# Altium project PCB_Project.PrjPcb (part 2 of 4)

## Sheet Power Supply.SchDoc
size A4; SheetNumber: 2; SheetTotal: 4
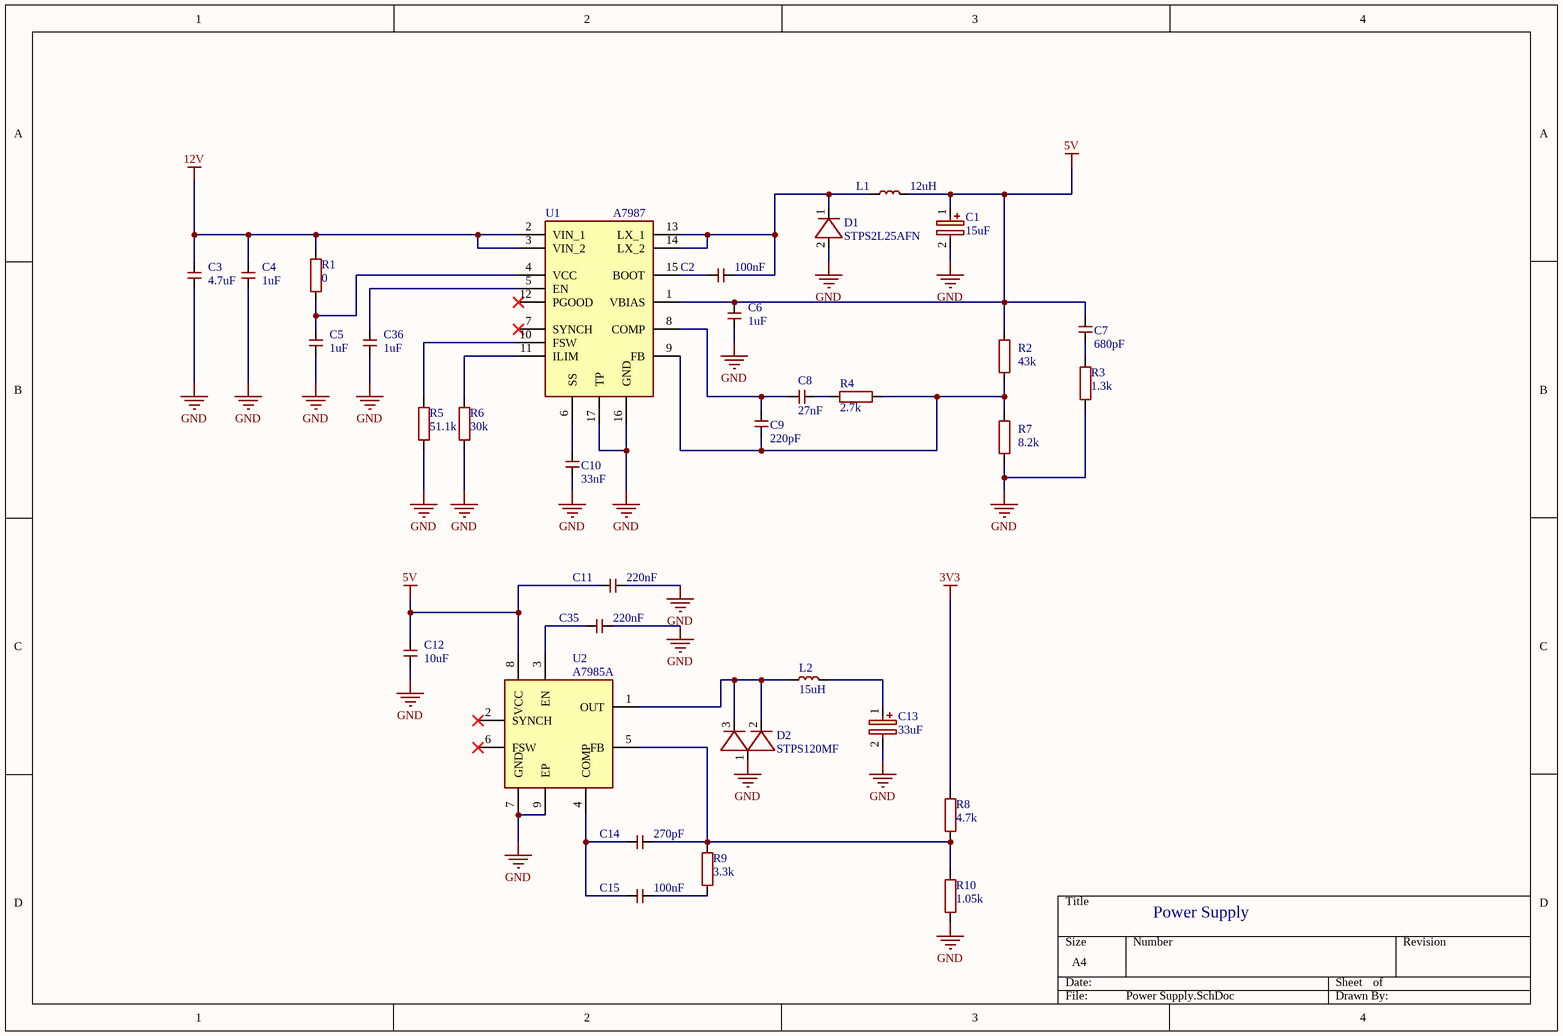
[diagram p1: Power Supply.SchDoc]

### Parts
C1  15uF  [CAPAE660X850N]
C2  100nF  [C0402]
C3  4.7uF  [CAPC3216X180N]
C4  1uF  [C0402]
C5  1uF  [C0402]
C6  1uF  [C0402]
C7  680pF  [C0402]
C8  27nF  [C0402]
C9  220pF  [C0402]
C10  33nF  [C0402]
C11  220nF  [C0402]
C12  10uF  [CAPC2012X145N]
C13  33uF  [10SVPS10M]
C14  270pF  [C0402]
C15  100nF  [C0402]
C35  220nF  [C0402]
C36  1uF  [C0402]
D1  STPS2L25AFN  [SODFL5226X110N]
D2  STPS120MF  [STPS120MF]
L1  12uH  [WE-PD2_105455]
L2  15uH  [INDPM6868X420N]
R1  0  [R0402]
R2  43k  [R0402]
R3  1.3k  [R0402]
R4  2.7k  [R0402]
R5  51.1k  [R0402]
R6  30k  [R0402]
R7  8.2k  [R0402]
R8  4.7k  [R0402]
R9  3.3k  [R0402]
R10  1.05k  [R0402]
U1  A7987  [SOP65P640X120-17N]
U2  A7985A  [SOIC127P600X170-9N]

### Nets
3V3: R8.2
5V: C1.1(+) C6.1 C7.2 C11.1 C12.2 L1.2 R2.2 U1.1(VBIAS) U2.8(VCC)
12V: C3.2 C4.2 R1.2 U1.2(VIN_1) U1.3(VIN_2)
GND: C1.2 C3.1 C4.1 C5.1 C6.2 C10.1 C11.2 C12.1 C13.2 C35.2 C36.1 D1.2(A) D2.1(A) R3.1 R5.1 R6.1 R7.1 R10.1 U1.16(GND) U1.17(TP) U2.7(GND) U2.9(EP)
NetC2_1: C2.1 U1.15(BOOT)
NetC2_2: C2.2 D1.1(K) L1.1 U1.13(LX_1) U1.14(LX_2)
NetC5_2: C5.2 R1.1 U1.4(VCC)
NetC7_1: C7.1 R3.2
NetC8_1: C8.1 C9.2 U1.8(COMP)
NetC8_2: C8.2 R4.1
NetC9_1: C9.1 R2.1 R4.2 R7.2 U1.9(FB)
NetC10_2: C10.2 U1.6(SS)
NetC13_1: C13.1(+) L2.2
NetC14_1: C14.1 C15.1 U2.4(COMP)
NetC14_2: C14.2 R8.1 R9.2 R10.2 U2.5(FB)
NetC15_2: C15.2 R9.1
NetC35_1: C35.1 U2.3(EN)
NetC36_2: C36.2 U1.5(EN)
NetD2_2: D2.2(K) D2.3(K) L2.1 U2.1(OUT)
NetR5_2: R5.2 U1.10(FSW)
NetR6_2: R6.2 U1.11(ILIM)

Not connected (* = marked no-connect by the designer): U1 7(SYNCH)* 12(PGOOD)*; U2 2(SYNCH)* 6(FSW)*

### Notes on the sheet
- Power Supply

### Library data of the parts
C1 = AHA0608150M050R: Hybrid Aluminum V-Chip, 15uF, 50V | AVX AHA0608150M050R; Manufacturer: Kyocera AVX; Supplier: Mouser; Supplier Part Number: 581-AHA0608150M050R; Manufacturer Part Number: AHA0608150M050R; RoHS: No; Category: Polymer Capacitors; Stock: 134; Pricing: 1=0.93, 10=0.586, 50=0.586, 100=0.582, 1000=0.494, 10000=0.262 (USD)
C2 C15 = C0402C104K3PACTU: Ceramic Capacitor, Multilayer, Ceramic, 25V, 10% +Tol, 10% -Tol, X5R, 15% TC, 0.1uF, Surface Mount, 0402; Manufacturer: KEMET; Multilayer: Yes; Supplier: Mouser; Supplier Part Number: 80-C0402C104K3P; Manufacturer Part Number: C0402C104K3PACTU; RoHS: Yes; Category: Ceramic Capacitors; Stock: 262570; Pricing: 1=0.12, 10=0.056, 50=0.056, 100=0.036, 1000=0.026, 10000=0.017 (USD); Mounting Technology: Surface Mount; Pins: 2; Dielectric Material: Ceramic; Package Shape: Rectangular; Case/Package: 0402; Terminal Finish: Nickel; Min Operating Temperature: -55°C; Max Operating Temperature: 85°C; JESD-609 Code: e3; Value: 100nF; Capacitor Type: Ceramic; Tolerance  (fill in as +-): 10%; Packaging: Tape and Reel; Tolerance (fill in as +-): 10%; Rated DC Voltage (URdc): 25V; Temperature Characteristics Code: X5R; Termination: Wraparound; Reach SVHC Compliant: Yes; RoHS Compliant: Yes; ComponentLink1URL: https://datasheet.ciiva.com:443/pdfs/VipMasterIC/IC/KEME/KEME-S-A0008991665/KEME-S-A0008991665-1.pdf?src-supplier=IHS+Markit; ComponentLink1Description: https://datasheet.ciiva.com:443/pdfs/VipMasterIC/IC/KEME/KEME-S-A0008991665/KEME-S-A0008991665-1.pdf?src-supplier=IHS+Markit; ComponentLink2URL: http://www.farnell.com/datasheets/2748284.pdf?src-supplier=Farnell; ComponentLink2Description: http://www.farnell.com/datasheets/2748284.pdf?src-supplier=Farnell; ComponentLink3URL: http://www.farnell.com/datasheets/2748284.pdf?src-supplier=Newark; ComponentLink3Description: http://www.farnell.com/datasheets/2748284.pdf?src-supplier=Newark; ComponentLink4URL: https://datasheet.octopart.com/C0402C104K3PACTU-KEMET-datasheet-181956028.pdf?src-supplier=Element14; ComponentLink4Description: https://datasheet.octopart.com/C0402C104K3PACTU-KEMET-datasheet-181956028.pdf?src-supplier=Element14
C3 = EMK316BJ475MLHT: Ceramic Capacitor, Multilayer, Ceramic, 16V, 20% +Tol, 20% -Tol, X5R, 15% TC, 4.7uF, Surface Mount, 1206; Manufacturer: Taiyo Yuden; Supplier: Mouser; Supplier Part Number: 963-EMK316BJ475MLHT; Manufacturer Part Number: EMK316BJ475MLHT; RoHS: No; Category: Ceramic Capacitors; Pricing: 1=0.3, 10=0.182, 50=0.182, 100=0.118, 1000=0.085, 10000=0.063 (USD); ComponentLink1URL: https://ds.yuden.co.jp/TYCOMPAS/ut/detail?pn=EMK316BJ475MLHT &amp;u=M&src-supplier=Digikey; ComponentLink1Description: https://ds.yuden.co.jp/TYCOMPAS/ut/detail?pn=EMK316BJ475MLHT &amp;u=M&src-supplier=Digikey
C4-C6 C36 = C0402C105K4PAC7411: Ceramic Capacitor, Multilayer, Ceramic, 16V, 10% +Tol, 10% -Tol, X5R, 15% TC, 1uF, Surface Mount, 0402; Manufacturer: KEMET; Multilayer: Yes; Supplier: Mouser; Supplier Part Number: 80-C0402C105K4P7411; Manufacturer Part Number: C0402C105K4PAC7411; RoHS: Yes; Category: Ceramic Capacitors; Stock: 78488; Pricing: 1=0.11, 10=0.061, 50=0.061, 100=0.037, 1000=0.024, 10000=0.019 (USD); Mounting Technology: Surface Mount; Pins: 2; Dielectric Material: Ceramic; Package Shape: Rectangular; Case/Package: 0402; Min Operating Temperature: -55°C; Max Operating Temperature: 85°C; Value: 1uF; Capacitor Type: Ceramic; Tolerance  (fill in as +-): 10%; Packaging: Tape and Reel; Tolerance (fill in as +-): 10%; Rated DC Voltage (URdc): 16V; Temperature Characteristics Code: X5R; Termination: Wraparound; Reach SVHC Compliant: Yes; RoHS Compliant: Yes; ComponentLink1URL: https://datasheet.ciiva.com:443/pdfs/VipMasterIC/IC/KEME/KEME-S-A0008991665/KEME-S-A0008991665-1.pdf?src-supplier=IHS+Markit; ComponentLink1Description: https://datasheet.ciiva.com:443/pdfs/VipMasterIC/IC/KEME/KEME-S-A0008991665/KEME-S-A0008991665-1.pdf?src-supplier=IHS+Markit; ComponentLink2URL: https://api.kemet.com/component-edge/download/datasheet/C0402C105K4PAC7411.pdf?src-supplier=Digikey; ComponentLink2Description: https://api.kemet.com/component-edge/download/datasheet/C0402C105K4PAC7411.pdf?src-supplier=Digikey; ComponentLink3URL: https://datasheet.octopart.com/C0402C105K4PAC7411-KEMET-datasheet-142027389.pdf?src-supplier=Farnell; ComponentLink3Description: https://datasheet.octopart.com/C0402C105K4PAC7411-KEMET-datasheet-142027389.pdf?src-supplier=Farnell
C7 = C0402C681K8RACTU: Ceramic Capacitor, Multilayer, Ceramic, 10V, 10% +Tol, 10% -Tol, X7R, 15% TC, 0.00068uF, Surface Mount, 0402; Manufacturer: KEMET; Multilayer: Yes; Supplier: Mouser; Supplier Part Number: 80-C0402C681K8RACTU; Manufacturer Part Number: C0402C681K8RACTU; RoHS: Yes; Category: Capacitors; Stock: 44783; Pricing: 1=0.34, 10=0.202, 50=0.202, 100=0.132, 1000=0.095, 10000=0.077 (USD); Mounting Technology: Surface Mount; Pins: 2; Dielectric Material: Ceramic; Case/Package: 0402; Terminal Finish: Nickel; Package Shape: Rectangular; Min Operating Temperature: -55°C; Max Operating Temperature: 125°C; JESD-609 Code: e3; Value: 680pF; Capacitor Type: Ceramic; Tolerance  (fill in as +-): 10%; Package Style: SMTMeter; Packaging: Tape and Reel; Tolerance (fill in as +-): 10%; Rated DC Voltage (URdc): 10V; Temperature Characteristics Code: X7R; Termination: Wraparound; Length: 1mm; Width: 0.5mm; Height: 0.5mm; Reach SVHC Compliant: Yes; RoHS Compliant: Yes; ComponentLink1URL: https://datasheet.ciiva.com:443/pdfs/VipMasterIC/IC/KEME/KEME-S-A0008991654/KEME-S-A0008991654-1.pdf?src-supplier=IHS+Markit; ComponentLink1Description: https://datasheet.ciiva.com:443/pdfs/VipMasterIC/IC/KEME/KEME-S-A0008991654/KEME-S-A0008991654-1.pdf?src-supplier=IHS+Markit
C8 = C0402C273K4RALTU: .027Uf 16.0V Rohs Compliant: No; Manufacturer: KEMET; Supplier: Mouser; Supplier Part Number: 80-C0402C273K4RALTU; Manufacturer Part Number: C0402C273K4RALTU; RoHS: No; Stock: 9745; Pricing: 1=0.57, 10=0.374, 50=0.374, 100=0.225, 1000=0.167, 10000=0.115 (USD)
C9 = C0402S221K5RACAUTO: Ceramic Capacitor, Multilayer, Ceramic, 50V, 10% +Tol, 10% -Tol, X7R, 15% TC, 0.00022uF, Surface Mount, 0402; Manufacturer: KEMET; Supplier: Mouser; Supplier Part Number: 80-C0402S221K5RAUTO; Manufacturer Part Number: C0402S221K5RACAUTO; RoHS: Yes; Category: Ceramic Capacitors; Stock: 19717; Pricing: 1=0.43, 10=0.225, 50=0.225, 100=0.163, 1000=0.127, 10000=0.098 (USD); Pins: 2; Dielectric Material: Ceramic; Capacitor Type: Ceramic; Reach SVHC Compliant: Yes; RoHS Compliant: Yes; ComponentLink1URL: https://datasheet.ciiva.com:443/pdfs/VipMasterIC/IC/KEME/KEME-S-A0008958426/KEME-S-A0008958426-1.pdf?src-supplier=IHS+Markit; ComponentLink1Description: https://datasheet.ciiva.com:443/pdfs/VipMasterIC/IC/KEME/KEME-S-A0008958426/KEME-S-A0008958426-1.pdf?src-supplier=IHS+Markit
C10 = C0402C333M4REC7411: Ceramic Capacitor, Multilayer, Ceramic, 16V, 20% +Tol, 20% -Tol, X7R, 15% TC, 0.033uF, Surface Mount, 0402; Manufacturer: KEMET; Supplier: Mouser; Supplier Part Number: 80-C0402C333M4RECLR; Manufacturer Part Number: C0402C333M4REC7411; RoHS: Yes; Category: Ceramic Capacitors; Stock: 47561; Pricing: 1=0.1, 10=0.059, 50=0.059, 100=0.036, 1000=0.026, 10000=0.018 (USD); Pins: 2; Dielectric Material: Ceramic; Capacitor Type: Ceramic; Reach SVHC Compliant: Yes; RoHS Compliant: Yes; ComponentLink1URL: https://datasheet.ciiva.com:443/pdfs/VipMasterIC/IC/KEME/KEME-S-A0008958450/KEME-S-A0008958450-1.pdf?src-supplier=IHS+Markit; ComponentLink1Description: https://datasheet.ciiva.com:443/pdfs/VipMasterIC/IC/KEME/KEME-S-A0008958450/KEME-S-A0008958450-1.pdf?src-supplier=IHS+Markit; ComponentLink2URL: https://api.kemet.com/component-edge/download/datasheet/C0402C333M4REC7411.pdf?src-supplier=Digikey; ComponentLink2Description: https://api.kemet.com/component-edge/download/datasheet/C0402C333M4REC7411.pdf?src-supplier=Digikey
C11 C35 = C0402C224K9PAC7411: Ceramic Capacitor, Multilayer, Ceramic, 6.3V, 10% +Tol, 10% -Tol, X5R, 15% TC, 0.22uF, Surface Mount, 0402; Manufacturer: KEMET; Multilayer: Yes; Supplier: Mouser; Supplier Part Number: 80-C0402C224K9PACLR; Manufacturer Part Number: C0402C224K9PAC7411; RoHS: Yes; Category: Ceramic Capacitors; Stock: 143956; Pricing: 1=0.1, 10=0.018, 50=0.018, 100=0.015, 1000=0.015, 10000=0.015 (USD); Mounting Technology: Surface Mount; Pins: 2; Dielectric Material: Ceramic; Package Shape: Rectangular; Case/Package: 0402; Terminal Finish: Nickel; Min Operating Temperature: -55°C; Max Operating Temperature: 85°C; JESD-609 Code: e3; Value: 220nF; Capacitor Type: Ceramic; Tolerance  (fill in as +-): 10%; Package Style: SMTMeter; Packaging: Tape and Reel; Tolerance (fill in as +-): 10%; Rated DC Voltage (URdc): 6.3V; Temperature Characteristics Code: X5R; Termination: Wraparound; Length: 1mm; Width: 0.5mm; Height: 0.5mm; Reach SVHC Compliant: Yes; RoHS Compliant: Yes; ComponentLink1URL: https://datasheet.ciiva.com:443/pdfs/VipMasterIC/IC/KEME/KEME-S-A0008991665/KEME-S-A0008991665-1.pdf?src-supplier=IHS+Markit; ComponentLink1Description: https://datasheet.ciiva.com:443/pdfs/VipMasterIC/IC/KEME/KEME-S-A0008991665/KEME-S-A0008991665-1.pdf?src-supplier=IHS+Markit; ComponentLink2URL: http://capacitoredge.kemet.com/capedge2/DataSheet?pn=C0402C224K9PAC7411&src-supplier=Avnet; ComponentLink2Description: http://capacitoredge.kemet.com/capedge2/DataSheet?pn=C0402C224K9PAC7411&src-supplier=Avnet; ComponentLink3URL: https://datasheet.octopart.com/C0402C224K9PAC7411-KEMET-datasheet-182899637.pdf?src-supplier=Farnell; ComponentLink3Description: https://datasheet.octopart.com/C0402C224K9PAC7411-KEMET-datasheet-182899637.pdf?src-supplier=Farnell
C12 = GRM21BR60J106KE19L: Ceramic Capacitor, Multilayer, Ceramic, 6.3V, 10% +Tol, 10% -Tol, X5R, 15% TC, 10uF, Surface Mount, 0805; Manufacturer: Murata; Multilayer: Yes; Supplier: Arrow Electronics; Supplier Part Number: GRM21BR60J106KE19L; Manufacturer Part Number: GRM21BR60J106KE19L; RoHS: Yes; Category: Ceramic Capacitors; Stock: 462000; Pricing: 3000=0.0427, 9000=0.0414, 24000=0.037, 45000=0.0357 (USD); Mounting Technology: Surface Mount; Pins: 2; Dielectric Material: Ceramic; Package Shape: Rectangular; Case/Package: 0805; Terminal Finish: Nickel; Min Operating Temperature: -55°C; Max Operating Temperature: 85°C; JESD-609 Code: e3; Value: 10uF; Capacitor Type: Ceramic; Tolerance  (fill in as +-): 10%; Package Style: SMTMeter; Packaging: Tape and Reel; Tolerance (fill in as +-): 10%; Rated DC Voltage (URdc): 6.3V; Temperature Characteristics Code: X5R; Termination: Wraparound; Length: 2mm; Width: 1.25mm; Height: 1.25mm; Reach SVHC Compliant: Yes; RoHS Compliant: Yes; ComponentLink1URL: https://datasheet.ciiva.com:443/pdfs/VipMasterIC/IC/MURE/MURE-S-A0004349797/MURE-S-A0004361791-1.pdf?src-supplier=IHS+Markit; ComponentLink1Description: https://datasheet.ciiva.com:443/pdfs/VipMasterIC/IC/MURE/MURE-S-A0004349797/MURE-S-A0004361791-1.pdf?src-supplier=IHS+Markit; ComponentLink2URL: https://datasheet.ciiva.com/3777/131grm21br60j106ke1923-3777038.pdf?src-supplier=Arrow+Electronics; ComponentLink2Description: https://datasheet.ciiva.com/3777/131grm21br60j106ke1923-3777038.pdf?src-supplier=Arrow+Electronics; ComponentLink3URL: https://datasheet.ciiva.com/136/product-136502.pdf?src-supplier=Digikey; ComponentLink3Description: https://datasheet.ciiva.com/136/product-136502.pdf?src-supplier=Digikey; ComponentLink4URL: https://datasheet.ciiva.com/19476/1858851-19476205.pdf?src-supplier=Jameco; ComponentLink4Description: https://datasheet.ciiva.com/19476/1858851-19476205.pdf?src-supplier=Jameco; ComponentLink5URL: https://datasheet.ciiva.com/7719/608985-7719084.pdf?src-supplier=Element14; ComponentLink5Description: https://datasheet.ciiva.com/7719/608985-7719084.pdf?src-supplier=Element14; ComponentLink6URL: https://datasheet.ciiva.com/136/product-136500.pdf?src-supplier=Digikey; ComponentLink6Description: https://datasheet.ciiva.com/136/product-136500.pdf?src-supplier=Digikey; ComponentLink7URL: https://datasheet.ciiva.com/136/product-136501.pdf?src-supplier=Digikey; ComponentLink7Description: https://datasheet.ciiva.com/136/product-136501.pdf?src-supplier=Digikey
C13 = 4SVP33M: Aluminum Electrolytic Capacitor, Polarized, Aluminum (solid Polymer), 4V, 20% +Tol, 20% -Tol, 33uF, Surface Mount, 1717; Manufacturer: Panasonic; Manufacturer Series: SVP; Dielectric Material: Aluminium; ESR (Equivalent Series Resistance): 200mR; Leakage Current: 66uA; Ripple Current: 37mA; Tan Delta: 0.15; Supplier: Mouser; Supplier Part Number: 667-4SVP33M; Manufacturer Part Number: 4SVP33M; RoHS: Yes; Category: Aluminum Electrolytic Capacitors; Stock: 1637; Pricing: 1=0.67, 10=0.519, 50=0.519, 100=0.508, 1000=0.44, 10000=0.362 (USD); Mounting Technology: Surface Mount; Pins: 2; Package Shape: Cylindrical; Case/Package: 1717; Min Operating Temperature: -55°C; Max Operating Temperature: 105°C; Polarity: Polarized; Value: 33uF; Capacitor Type: Aluminium; Tolerance  (fill in as +-): 20%; Package Style: SMTMeter; Packaging: Tape and Reel; Tolerance (fill in as +-): 20%; Rated DC Voltage (URdc): 4V; Series: SVP; Termination: Flat; Length: 5mm; Width: 4.3mm; Height: 5.4mm; Reach SVHC Compliant: Yes; RoHS Compliant: Yes; ComponentLink1URL: https://datasheet.ciiva.com:443/pdfs/VipMasterIC/IC/PANA/PANA-S-A0009016943/PANA-S-A0009016943-1.pdf?src-supplier=IHS+Markit; ComponentLink1Description: https://datasheet.ciiva.com:443/pdfs/VipMasterIC/IC/PANA/PANA-S-A0009016943/PANA-S-A0009016943-1.pdf?src-supplier=IHS+Markit; ComponentLink2URL: https://datasheet.ciiva.com/24477/svp-series-datasheet-24477337.pdf?src-supplier=Onlinecomponents.com; ComponentLink2Description: https://datasheet.ciiva.com/24477/svp-series-datasheet-24477337.pdf?src-supplier=Onlinecomponents.com
C14 = C0402C271J5GAC7411: Ceramic Capacitor, Multilayer, Ceramic, 50V, 5% +Tol, 5% -Tol, C0G, 30ppm/Cel TC, 0.00027uF, Surface Mount, 0402; Manufacturer: KEMET; Multilayer: Yes; Supplier: Mouser; Supplier Part Number: 80-C0402C271J5G7411; Manufacturer Part Number: C0402C271J5GAC7411; RoHS: Yes; Category: Ceramic Capacitors; Stock: 143215; Pricing: 1=0.1, 10=0.018, 50=0.018, 100=0.011, 1000=0.008, 10000=0.007 (USD); Mounting Technology: Surface Mount; Pins: 2; Dielectric Material: Ceramic; Package Shape: Rectangular; Case/Package: 0402; Terminal Finish: Nickel; Min Operating Temperature: -55°C; Max Operating Temperature: 125°C; JESD-609 Code: e3; Value: 270pF; Capacitor Type: Ceramic; Tolerance  (fill in as +-): 5%; Package Style: SMTMeter; Packaging: Tape and Reel; Tolerance (fill in as +-): 5%; Rated DC Voltage (URdc): 50V; Temperature Characteristics Code: C0G; Termination: Wraparound; Length: 1mm; Width: 0.5mm; Height: 0.5mm; Reach SVHC Compliant: Yes; RoHS Compliant: Yes; ComponentLink1URL: https://datasheet.ciiva.com:443/pdfs/VipMasterIC/IC/KEME/KEME-S-A0005605168/KEME-S-A0005605168-1.pdf?src-supplier=IHS+Markit; ComponentLink1Description: https://datasheet.ciiva.com:443/pdfs/VipMasterIC/IC/KEME/KEME-S-A0005605168/KEME-S-A0005605168-1.pdf?src-supplier=IHS+Markit
D1 = STPS2L25AFN: Rectifier Diode; Manufacturer: STMicroelectronics; Supplier: Farnell; Supplier Part Number: 3387295; Manufacturer Part Number: STPS2L25AFN; RoHS: Yes; Category: Rectifier Diodes; Stock: 3; Pricing: 1=1 (EUR)
D2 = STPS120MF: Rectifier Diode, Schottky, 1 Phase, 1 Element, 1A, 20V V(RRM), Silicon, DO-222AA; Manufacturer: STMicroelectronics; Package Body Material: Plastic; Case Connection: CATHODE; Forward Voltage: 410mV; Non-rep Pk Forward Current-Max: 50A; Number of Elements: 1; Qualification Status: Not Qualified; Supplier: Mouser; Supplier Part Number: 511-STPS120MF; Manufacturer Part Number: STPS120MF; RoHS: Yes; Category: Rectifier Diodes; Stock: 19149; Pricing: 1=0.28, 10=0.18, 50=0.18, 100=0.118, 1000=0.092, 10000=0.084 (USD); Pins: 2; Diode Element Material: SILICON; Package Shape: Rectangular; Max Operating Temperature: 150°C; Diode Type: RECTIFIER; JESD-30 Code: R-PDSO-F2; Max Output current: 1A; Package Style: SMALL OUTLINEMeter; Rep Pk Reverse Voltage-Max: 20V; Surface Mount: Yes; Technology: SCHOTTKY; Terminal Form: Flat; Terminal Position: DUAL; Reach SVHC Compliant: Yes; RoHS Compliant: Yes; ComponentLink1URL: https://datasheet.ciiva.com:443/pdfs/VipMasterIC/IC/SGST/SGST-S-A0001365098/SGST-S-A0001365098-1.pdf?src-supplier=IHS+Markit; ComponentLink1Description: https://datasheet.ciiva.com:443/pdfs/VipMasterIC/IC/SGST/SGST-S-A0001365098/SGST-S-A0001365098-1.pdf?src-supplier=IHS+Markit; ComponentLink2URL: https://datasheet.ciiva.com/4714/cd00198749-86002-4714686.pdf?src-supplier=Mouser; ComponentLink2Description: https://datasheet.ciiva.com/4714/cd00198749-86002-4714686.pdf?src-supplier=Mouser; ComponentLink3URL: https://datasheet.ciiva.com/16491/cd00198749-16491507.pdf?src-supplier=Future+Electronics; ComponentLink3Description: https://datasheet.ciiva.com/16491/cd00198749-16491507.pdf?src-supplier=Future+Electronics; ComponentLink4URL: https://datasheet.ciiva.com/916/cd00198749-916327.pdf?src-supplier=Digikey; ComponentLink4Description: https://datasheet.ciiva.com/916/cd00198749-916327.pdf?src-supplier=Digikey; ComponentLink5URL: https://datasheet.ciiva.com/916/cd00198749-916328.pdf?src-supplier=Digikey; ComponentLink5Description: https://datasheet.ciiva.com/916/cd00198749-916328.pdf?src-supplier=Digikey; ComponentLink6URL: https://datasheet.ciiva.com/916/cd00198749-916329.pdf?src-supplier=Digikey; ComponentLink6Description: https://datasheet.ciiva.com/916/cd00198749-916329.pdf?src-supplier=Digikey
L1 = 744776112: General Purpose Inductor, 12uH, 20%, 1 Element, Nickel-zinc Ferrite-Core, SMD, 3935; Manufacturer: Wurth Electronics; DC Resistance (DCR): 70mR; Inductor Application: POWER INDUCTOR; Channels: 1; Max Current Rating: 2.72A; Shape/Size Description: RECTANGULAR PACKAGE; Shielding: Unshielded; Test Frequency: 1kHz; Self Resonant Frequency: 20MHz; Supplier: Mouser; Supplier Part Number: 710-744776112; Manufacturer Part Number: 744776112; RoHS: Yes; Category: Fixed Inductors; Stock: 180; Pricing: 1=2.29, 10=2.22, 50=2.14, 100=2.1, 1000=1.7, 10000=1.7 (USD); Pins: 2; Terminal Finish: Copper; Core Material: Ferrite; Min Operating Temperature: -40°C; Max Operating Temperature: 125°C; Tolerance: 20%; JESD-609 Code: e1; Inductance-Nom (L): 12uH; Inductor Type: GENERAL PURPOSE INDUCTOR; Surface Mount: Yes; Terminal Placement: Dual Ended; Termination: One Surface; Reach SVHC Compliant: Yes; RoHS Compliant: Yes; ComponentLink1URL: https://datasheet.ciiva.com:443/pdfs/VipMasterIC/IC/MIDC/MIDC-S-A0009028210/MIDC-S-A0009028303-1.pdf?src-supplier=IHS+Markit; ComponentLink1Description: https://datasheet.ciiva.com:443/pdfs/VipMasterIC/IC/MIDC/MIDC-S-A0009028210/MIDC-S-A0009028303-1.pdf?src-supplier=IHS+Markit; ComponentLink2URL: https://datasheet.ciiva.com/1063/744776112-1063302.pdf?src-supplier=Digikey; ComponentLink2Description: https://datasheet.ciiva.com/1063/744776112-1063302.pdf?src-supplier=Digikey; ComponentLink3URL: https://datasheet.ciiva.com/6696/744776112-6696301.pdf?src-supplier=Digikey; ComponentLink3Description: https://datasheet.ciiva.com/6696/744776112-6696301.pdf?src-supplier=Digikey; ComponentLink4URL: https://datasheet.ciiva.com/4954/744776112-37936-4954902.pdf?src-supplier=Mouser; ComponentLink4Description: https://datasheet.ciiva.com/4954/744776112-37936-4954902.pdf?src-supplier=Mouser; ComponentLink5URL: https://datasheet.ciiva.com/7892/1736454-7892919.pdf?src-supplier=Element14; ComponentLink5Description: https://datasheet.ciiva.com/7892/1736454-7892919.pdf?src-supplier=Element14; ComponentLink6URL: https://datasheet.ciiva.com/6696/744776112-6696300.pdf?src-supplier=Digikey; ComponentLink6Description: https://datasheet.ciiva.com/6696/744776112-6696300.pdf?src-supplier=Digikey
L2 = SRR6838A-150M: Power Inductors - SMD Ind,6.8x6.8x3.8mm,15uH+/-20%,2.1A,; Manufacturer: Bourns; Supplier: Mouser; Supplier Part Number: 652-SRR6838A-150M; Manufacturer Part Number: SRR6838A-150M; RoHS: No; Stock: 987; Pricing: 1=1.28, 10=0.992, 50=0.992, 100=0.851, 1000=0.723, 10000=0.695 (USD)
R1 = AC0402JR-7D0RL: Fixed Resistor, Metal Glaze/thick Film, 0.0625W, 0ohm, Surface Mount, 0402; Manufacturer: Yageo; Supplier: Mouser; Supplier Part Number: 603-AC0402JR-7D0RL; Manufacturer Part Number: AC0402JR-7D0RL; RoHS: Yes; Category: Resistors; Stock: 155617; Pricing: 1=0.14, 10=0.014, 50=0.014, 100=0.009, 1000=0.008, 10000=0.004 (USD)
R2 = AF0402FR-0743KL: Fixed Resistor, Metal Glaze/thick Film, 0.0625W, 43000ohm, 50V, 1% +/-Tol, 100ppm/Cel, Surface Mount, 0402; Manufacturer: Yageo; Additional Feature: ANTI-SULFUR; Power: 62.5mW; Rated Temperature: 70°C; Value: 43kR; Temperature Coefficient (ppm/Cel): 100; Package Height: 0.32mm; Package Length: 1mm; Package Width: 0.5mm; Reference Standard: AEC-Q200; Supplier: Mouser; Supplier Part Number: 603-AF0402FR-0743KL; Manufacturer Part Number: AF0402FR-0743KL; RoHS: Yes; Category: Chip SMD Resistors; Stock: 9222; Pricing: 1=0.1, 10=0.022, 50=0.022, 100=0.016, 1000=0.012, 10000=0.006 (USD); Mounting Technology: Surface Mount; Pins: 2; Case/Package: 0402; Min Operating Temperature: -55°C; Max Operating Temperature: 155°C; Tolerance: 1%; Resistor Type: FIXED RESISTOR; Construction: Rectangular; Packaging: Tape and Reel; Termination: Wraparound; Working Voltage: 50V; Reach SVHC Compliant: Yes; RoHS Compliant: Yes; ComponentLink1URL: https://datasheet.ciiva.com:443/pdfs/VipMasterIC/IC/YAGO/YAGO-S-A0009016998/YAGO-S-A0009016998-1.pdf?src-supplier=IHS+Markit; ComponentLink1Description: https://datasheet.ciiva.com:443/pdfs/VipMasterIC/IC/YAGO/YAGO-S-A0009016998/YAGO-S-A0009016998-1.pdf?src-supplier=IHS+Markit; ComponentLink2URL: http://www.yageo.com/documents/recent/PYu-AF_51_RoHS_L_5.pdf?src-supplier=Digikey; ComponentLink2Description: http://www.yageo.com/documents/recent/PYu-AF_51_RoHS_L_5.pdf?src-supplier=Digikey
R3 = AT0402DRD071K3L: Fixed Resistor, Thin Film, 0.0625W, 1300ohm, 50V, 0.5% +/-Tol, 25ppm/Cel, Surface Mount, 0402; Manufacturer: Yageo; Additional Feature: HIGH PRECISION; Power: 62.5mW; Rated Temperature: 70°C; Value: 1.3kR; Temperature Coefficient (ppm/Cel): 25; Package Height: 0.3mm; Package Length: 1mm; Package Width: 0.5mm; Reference Standard: AEC-Q200; Supplier: Mouser; Supplier Part Number: 603-AT0402DRD071K3L; Manufacturer Part Number: AT0402DRD071K3L; RoHS: Yes; Category: Chip SMD Resistors; Stock: 5742; Pricing: 1=0.14, 10=0.102, 50=0.082, 100=0.073, 1000=0.05, 10000=0.031 (USD); Mounting Technology: Surface Mount; Pins: 2; Package Shape: Rectangular; Case/Package: 0402; Min Operating Temperature: -55°C; Max Operating Temperature: 155°C; Tolerance: 0.5%; Resistor Type: FIXED RESISTOR; Construction: Chip; Packaging: Tape and Reel; Technology: THIN FILM; Termination: Wraparound; Working Voltage: 50V; Reach SVHC Compliant: Yes; RoHS Compliant: Yes; ComponentLink1URL: https://datasheet.ciiva.com:443/pdfs/VipMasterIC/IC/YAGO/YAGO-S-A0003527576/YAGO-S-A0003527576-1.pdf?src-supplier=IHS+Markit; ComponentLink1Description: https://datasheet.ciiva.com:443/pdfs/VipMasterIC/IC/YAGO/YAGO-S-A0003527576/YAGO-S-A0003527576-1.pdf?src-supplier=IHS+Markit; ComponentLink2URL: http://www.yageo.com/documents/recent/PYu-AT_51_RoHS_L-3.pdf?src-supplier=Digikey; ComponentLink2Description: http://www.yageo.com/documents/recent/PYu-AT_51_RoHS_L-3.pdf?src-supplier=Digikey
R4 = AC0402FR-072K7L: Fixed Resistor, Metal Glaze/thick Film, 0.0625W, 2700ohm, 50V, 1% +/-Tol, 100ppm/Cel, Surface Mount, 0402; Manufacturer: Yageo; Additional Feature: LASER TRIMMABLE; Power: 62.5mW; Rated Temperature: 70°C; Value: 2.7kR; Temperature Coefficient (ppm/Cel): 100; Package Height: 0.32mm; Package Length: 1mm; Package Width: 0.5mm; Reference Standard: AEC-Q200; Supplier: Mouser; Supplier Part Number: 603-AC0402FR-072K7L; Manufacturer Part Number: AC0402FR-072K7L; RoHS: Yes; Category: Chip SMD Resistors; Stock: 89734; Pricing: 1=0.1, 10=0.009, 50=0.009, 100=0.007, 1000=0.005, 10000=0.002 (USD); Mounting Technology: Surface Mount; Pins: 2; Package Shape: Rectangular; Case/Package: 0402; Terminal Finish: Nickel; Min Operating Temperature: -55°C; Max Operating Temperature: 155°C; Tolerance: 1%; JESD-609 Code: e3; Resistor Type: FIXED RESISTOR; Construction: Chip; Packaging: Tape and Reel; Technology: METAL GLAZE/THICK FILM; Termination: Wraparound; Working Voltage: 50V; Reach SVHC Compliant: Yes; RoHS Compliant: Yes; ComponentLink1URL: https://datasheet.ciiva.com:443/pdfs/VipMasterIC/IC/YAGO/YAGO-S-A0003597364/YAGO-S-A0003597364-1.pdf?src-supplier=IHS+Markit; ComponentLink1Description: https://datasheet.ciiva.com:443/pdfs/VipMasterIC/IC/YAGO/YAGO-S-A0003597364/YAGO-S-A0003597364-1.pdf?src-supplier=IHS+Markit; ComponentLink2URL: https://datasheet.ciiva.com/12576/pyu-ac-51-rohs-l-2-12576316.pdf?src-supplier=Mouser; ComponentLink2Description: https://datasheet.ciiva.com/12576/pyu-ac-51-rohs-l-2-12576316.pdf?src-supplier=Mouser
R5 = RT0402BRE0751K1L: Fixed Resistor, Thin Film, 0.0625W, 51100ohm, 50V, 0.1% +/-Tol, 50ppm/Cel, Surface Mount, 0402; Manufacturer: Yageo; Additional Feature: HIGH PRECISION; Power: 62.5mW; Rated Temperature: 70°C; Value: 51.1kR; Temperature Coefficient (ppm/Cel): 50; Package Height: 0.3mm; Package Length: 1mm; Package Width: 0.5mm; Supplier: Mouser; Supplier Part Number: 603-RT0402BRE0751K1L; Manufacturer Part Number: RT0402BRE0751K1L; RoHS: Yes; Category: Chip SMD Resistors; Stock: 6687; Pricing: 1=0.2, 10=0.144, 50=0.113, 100=0.101, 1000=0.068, 10000=0.045 (USD); Mounting Technology: Surface Mount; Pins: 2; Case/Package: 0402; Min Operating Temperature: -55°C; Max Operating Temperature: 155°C; Tolerance: 0.1%; Resistor Type: FIXED RESISTOR; Construction: Chip; Packaging: Tape and Reel; Technology: THIN FILM; Termination: Wraparound; Working Voltage: 50V; Reach SVHC Compliant: Yes; RoHS Compliant: Yes; ComponentLink1URL: https://datasheet.ciiva.com:443/pdfs/VipMasterIC/IC/YAGO/YAGO-S-A0008510989/YAGO-S-A0008510989-1.pdf?src-supplier=IHS+Markit; ComponentLink1Description: https://datasheet.ciiva.com:443/pdfs/VipMasterIC/IC/YAGO/YAGO-S-A0008510989/YAGO-S-A0008510989-1.pdf?src-supplier=IHS+Markit; ComponentLink2URL: http://www.yageo.com/documents/recent/PYu-RT_1-to-0.01_RoHS_L_9.pdf?src-supplier=Digikey; ComponentLink2Description: http://www.yageo.com/documents/recent/PYu-RT_1-to-0.01_RoHS_L_9.pdf?src-supplier=Digikey
R6 = RC0402FR-1330KL: Fixed Resistor, Metal Glaze/thick Film, 0.0625W, 30000ohm, 50V, 1% +/-Tol, 100ppm/Cel, Surface Mount, 0402; Manufacturer: Yageo; Additional Feature: LASER TRIMMABLE; Power: 62.5mW; Rated Temperature: 70°C; Value: 30kR; Temperature Coefficient (ppm/Cel): 100; Package Height: 0.35mm; Package Length: 1mm; Package Width: 0.5mm; Supplier: Mouser; Supplier Part Number: 603-RC0402FR-1330KL; Manufacturer Part Number: RC0402FR-1330KL; RoHS: Yes; Category: Chip SMD Resistors; Stock: 104196; Pricing: 1=0.1, 10=0.01, 50=0.01, 100=0.007, 1000=0.006, 10000=0.003 (USD); Mounting Technology: Surface Mount; Pins: 2; Package Shape: Rectangular; Case/Package: 0402; Terminal Finish: Nickel; Min Operating Temperature: -55°C; Max Operating Temperature: 155°C; Tolerance: 1%; JESD-609 Code: e3; Resistor Type: FIXED RESISTOR; Construction: Chip; Packaging: Tape and Reel; Technology: METAL GLAZE/THICK FILM; Termination: Wraparound; Working Voltage: 50V; Reach SVHC Compliant: Yes; RoHS Compliant: Yes; ComponentLink1URL: https://datasheet.ciiva.com:443/pdfs/VipMasterIC/IC/YAGO/YAGO-S-A0008145938/YAGO-S-A0008145938-1.pdf?src-supplier=IHS+Markit; ComponentLink1Description: https://datasheet.ciiva.com:443/pdfs/VipMasterIC/IC/YAGO/YAGO-S-A0008145938/YAGO-S-A0008145938-1.pdf?src-supplier=IHS+Markit; ComponentLink2URL: https://datasheet.ciiva.com/8889/pyu-rc0402-51-rohs-l-6-8889740.pdf?src-supplier=Avnet; ComponentLink2Description: https://datasheet.ciiva.com/8889/pyu-rc0402-51-rohs-l-6-8889740.pdf?src-supplier=Avnet
R7 = RC0402BR-078K2L: Fixed Resistor, Metal Glaze/thick Film, 0.0625W, 8200ohm, 50V, 0.1% +/-Tol, 100ppm/Cel, Surface Mount, 0402; Manufacturer: Yageo; Supplier: Mouser; Supplier Part Number: 603-RC0402BR-078K2L; Manufacturer Part Number: RC0402BR-078K2L; RoHS: Yes; Stock: 8780; Pricing: 1=0.18, 10=0.122, 50=0.098, 100=0.088, 1000=0.059, 10000=0.039 (USD); Reach SVHC Compliant: Yes; RoHS Compliant: Yes
R8 = RC0402FR-7W4K7L: Fixed Resistor, Metal Glaze/thick Film, 0.125W, 4700ohm, 50V, 1% +/-Tol, 200ppm/Cel, Surface Mount, 0402; Manufacturer: Yageo; Additional Feature: LASER TRIMMABLE; Power: 125mW; Rated Temperature: 70°C; Value: 4.7kR; Temperature Coefficient (ppm/Cel): 200; Package Height: 0.35mm; Package Length: 1mm; Package Width: 0.5mm; Supplier: Mouser; Supplier Part Number: 603-RC0402FR-7W4K7L; Manufacturer Part Number: RC0402FR-7W4K7L; RoHS: Yes; Category: Chip SMD Resistors; Stock: 9262; Pricing: 1=0.15, 10=0.015, 50=0.015, 100=0.01, 1000=0.008, 10000=0.003 (USD); Mounting Technology: Surface Mount; Pins: 2; Package Shape: Rectangular; Case/Package: 0402; Terminal Finish: Nickel; Min Operating Temperature: -55°C; Max Operating Temperature: 155°C; Tolerance: 1%; JESD-609 Code: e3; Resistor Type: FIXED RESISTOR; Construction: Chip; Packaging: Tape and Reel; Technology: METAL GLAZE/THICK FILM; Termination: Wraparound; Working Voltage: 50V; Reach SVHC Compliant: Yes; RoHS Compliant: Yes; ComponentLink1URL: https://datasheet.ciiva.com:443/pdfs/VipMasterIC/IC/YAGO/YAGO-S-A0008145938/YAGO-S-A0008145938-1.pdf?src-supplier=IHS+Markit; ComponentLink1Description: https://datasheet.ciiva.com:443/pdfs/VipMasterIC/IC/YAGO/YAGO-S-A0008145938/YAGO-S-A0008145938-1.pdf?src-supplier=IHS+Markit
R9 = RC0402FR-7D3K3L: Fixed Resistor, Metal Glaze/thick Film, 0.0625W, 3300ohm, 50V, 1% +/-Tol, 100ppm/Cel, Surface Mount, 0402; Manufacturer: Yageo; Additional Feature: LASER TRIMMABLE; Power: 62.5mW; Rated Temperature: 70°C; Value: 3.3kR; Temperature Coefficient (ppm/Cel): 100; Package Height: 0.35mm; Package Length: 1mm; Package Width: 0.5mm; Supplier: Mouser; Supplier Part Number: 603-RC0402FR-7D3K3L; Manufacturer Part Number: RC0402FR-7D3K3L; RoHS: Yes; Category: Resistors; Stock: 400223; Pricing: 1=0.1, 10=0.01, 50=0.01, 100=0.007, 1000=0.006, 10000=0.003 (USD); Mounting Technology: Surface Mount; Pins: 2; Package Shape: Rectangular; Case/Package: 0402; Terminal Finish: Nickel; Min Operating Temperature: -55°C; Max Operating Temperature: 155°C; Tolerance: 1%; JESD-609 Code: e3; Resistor Type: FIXED RESISTOR; Construction: Chip; Packaging: Tape and Reel; Technology: METAL GLAZE/THICK FILM; Termination: Wraparound; Working Voltage: 50V; Reach SVHC Compliant: Yes; RoHS Compliant: Yes
R10 = AC0402FR-071K05L: Fixed Resistor, Metal Glaze/thick Film, 0.0625W, 1050ohm, 50V, 1% +/-Tol, 100ppm/Cel, Surface Mount, 0402; Manufacturer: Yageo; Additional Feature: LASER TRIMMABLE; Power: 62.5mW; Rated Temperature: 70°C; Value: 1.05kR; Temperature Coefficient (ppm/Cel): 100; Package Height: 0.32mm; Package Length: 1mm; Package Width: 0.5mm; Reference Standard: AEC-Q200; Supplier: Mouser; Supplier Part Number: 603-AC0402FR-071K05L; Manufacturer Part Number: AC0402FR-071K05L; RoHS: Yes; Category: Chip SMD Resistors; Stock: 33067; Pricing: 1=0.1, 10=0.005, 50=0.005, 100=0.005, 1000=0.005, 10000=0.002 (USD); Mounting Technology: Surface Mount; Pins: 2; Package Shape: Rectangular; Case/Package: 0402; Terminal Finish: Nickel; Min Operating Temperature: -55°C; Max Operating Temperature: 155°C; Tolerance: 1%; JESD-609 Code: e3; Resistor Type: FIXED RESISTOR; Construction: Chip; Packaging: Tape and Reel; Technology: METAL GLAZE/THICK FILM; Termination: Wraparound; Working Voltage: 50V; Reach SVHC Compliant: Yes; RoHS Compliant: Yes; ComponentLink1URL: https://datasheet.ciiva.com:443/pdfs/VipMasterIC/IC/YAGO/YAGO-S-A0003597364/YAGO-S-A0003597364-1.pdf?src-supplier=IHS+Markit; ComponentLink1Description: https://datasheet.ciiva.com:443/pdfs/VipMasterIC/IC/YAGO/YAGO-S-A0003597364/YAGO-S-A0003597364-1.pdf?src-supplier=IHS+Markit; ComponentLink2URL: http://www.yageo.com/NewPortal/yageodocoutput?fileName=/pdf/R-Chip/PYu-AC_51_RoHS_L_6.pdf&src-supplier=Digikey; ComponentLink2Description: http://www.yageo.com/NewPortal/yageodocoutput?fileName=/pdf/R-Chip/PYu-AC_51_RoHS_L_6.pdf&src-supplier=Digikey
U1 = A7987TR: Switching Regulator, Voltage-mode, 4.4A, 1650kHz Switching Freq-Max, PDSO16; Manufacturer: STMicroelectronics; Supplier: Mouser; Supplier Part Number: 511-A7987TR; Manufacturer Part Number: A7987TR; RoHS: Yes; Category: Voltage Regulators - Switching; Stock: 4709; Pricing: 1=5.04, 10=3.84, 50=3.54, 100=3.21, 1000=2.88, 10000=2.58 (USD); RoHS Compliant: Yes; ComponentLink1URL: https://www.st.com/resource/en/datasheet/a7987.pdf?src-supplier=Digikey; ComponentLink1Description: https://www.st.com/resource/en/datasheet/a7987.pdf?src-supplier=Digikey; ComponentLink2URL: https://datasheet.octopart.com/A7987TR-STMicroelectronics-datasheet-153441496.pdf?src-supplier=Element14; ComponentLink2Description: https://datasheet.octopart.com/A7987TR-STMicroelectronics-datasheet-153441496.pdf?src-supplier=Element14
U2 = A7985ATR: Switching Regulator, Voltage-mode, 3.5A, 275kHz Switching Freq-Max, PDSO8; Manufacturer: STMicroelectronics; Package Body Material: Plastic; Package Equivalence Code: SOP8,.25; Control Technique: PULSE WIDTH MODULATION; Max Supply Voltage: 38V; Min Input Voltage: 4.5V; Nominal Supply Voltage: 12V; Channels: 1; Switcher Configuration: BUCK; Qualification Status: Not Qualified; Supplier: Mouser; Supplier Part Number: 511-A7985ATR; Manufacturer Part Number: A7985ATR; RoHS: Yes; Category: Voltage Regulators - Switching; Stock: 5225; Pricing: 1=1.76, 10=1.51, 50=1.42, 100=1.34, 1000=1.24, 10000=1.1 (USD); Case/Package: HLSOP; Pins: 8; Package Shape: Rectangular; Terminal Finish: Tin; Min Operating Temperature: -40°C; Max Operating Temperature: 125°C; Throw Configuration: SWITCHING REGULATOR; Control Mode: VOLTAGE-MODE; JESD-30 Code: R-PDSO-G8; Max Output current: 3.5A; Package Style: SMALL OUTLINE, HEAT SINK/SLUG, LOW PROFILEMeter; Surface Mount: Yes; Frequency: 275kHz; Terminal Form: Gull Wing; Terminal Position: DUAL; JESD-609 Code: e3; Moisture Sensitivity Level: 3; Length: 4.9mm; Width: 3.9mm; Terminal Pitch: 1.27mm; Height - Seated (Max): 1.7mm; Reach SVHC Compliant: Yes; RoHS Compliant: Yes; Temperature Grade: AUTOMOTIVE; ComponentLink1URL: https://datasheet.ciiva.com:443/pdfs/VipMasterIC/IC/SGST/SGST-S-A0002908266/SGST-S-A0002908266-1.pdf?src-supplier=IHS+Markit; ComponentLink1Description: https://datasheet.ciiva.com:443/pdfs/VipMasterIC/IC/SGST/SGST-S-A0002908266/SGST-S-A0002908266-1.pdf?src-supplier=IHS+Markit; ComponentLink2URL: https://datasheet.ciiva.com/41458/001184805-da-01-en-ic-reg-buck-adj-2a-a7985atr-soic-8-stm-41458161.pdf?src-supplier=Conrad; ComponentLink2Description: https://datasheet.ciiva.com/41458/001184805-da-01-en-ic-reg-buck-adj-2a-a7985atr-soic-8-stm-41458161.pdf?src-supplier=Conrad; ComponentLink3URL: https://datasheet.ciiva.com/6603/dm00053375-6603398.pdf?src-supplier=Digikey; ComponentLink3Description: https://datasheet.ciiva.com/6603/dm00053375-6603398.pdf?src-supplier=Digikey; ComponentLink4URL: https://datasheet.ciiva.com/6603/dm00053375-6603399.pdf?src-supplier=Digikey; ComponentLink4Description: https://datasheet.ciiva.com/6603/dm00053375-6603399.pdf?src-supplier=Digikey; ComponentLink5URL: https://datasheet.ciiva.com/6603/dm00053375-6603401.pdf?src-supplier=Digikey; ComponentLink5Description: https://datasheet.ciiva.com/6603/dm00053375-6603401.pdf?src-supplier=Digikey